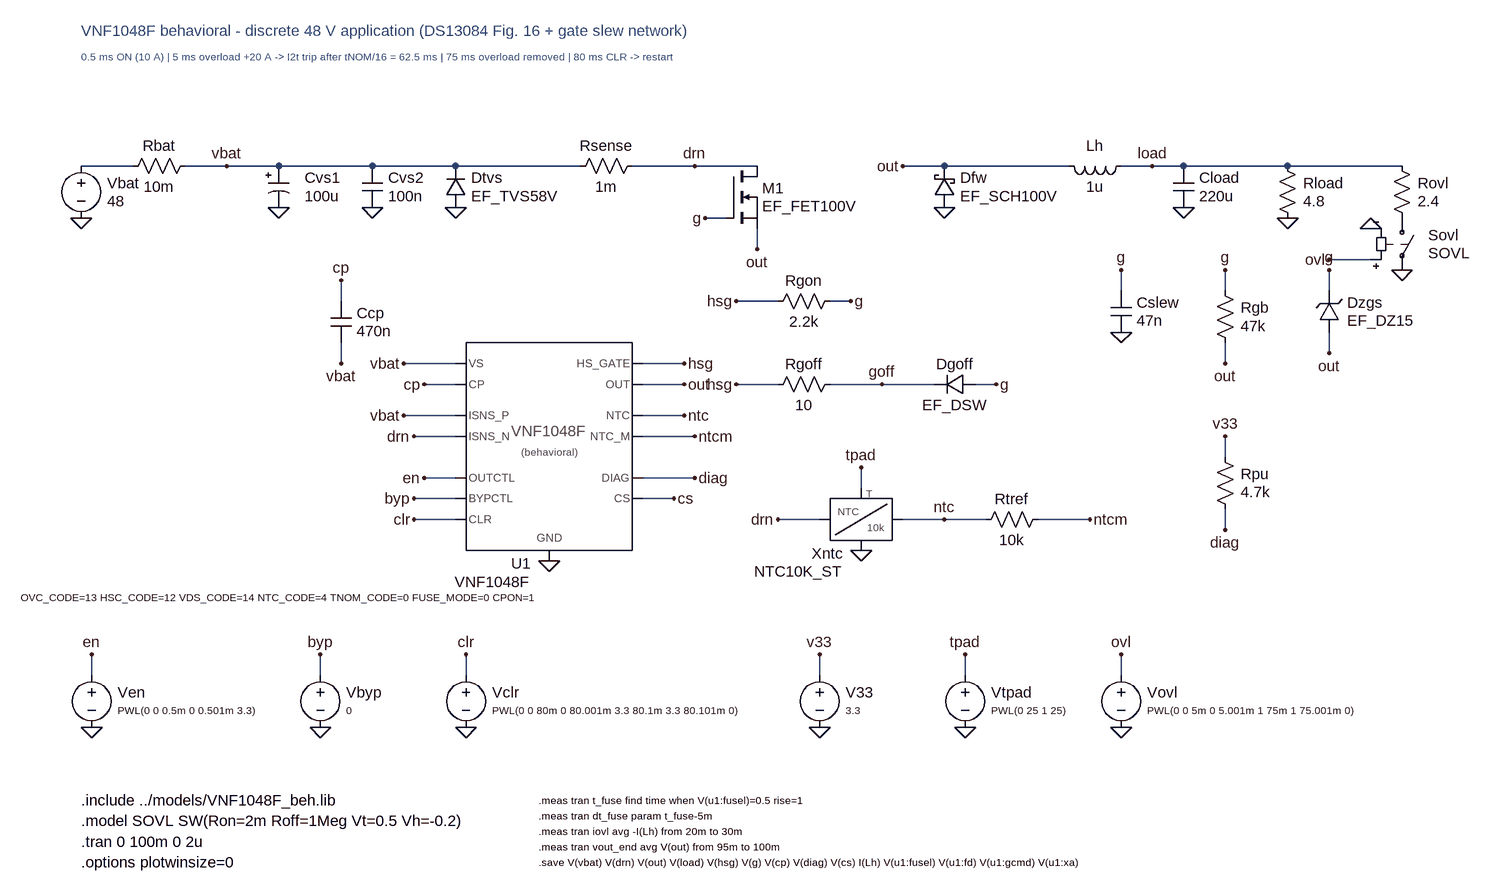
[diagram p0: schematic app_vnf1048f_discrete.asc]
app_vnf1048f_discrete.asc, the LTspice schematic file:
Version 4
SHEET 1 2300 1300
SYMBOL voltage 48 128 R0
WINDOW 0 40 42 Left 2
WINDOW 3 40 70 Left 2
SYMATTR InstName Vbat
SYMATTR Value 48
FLAG 48 224 0
SYMBOL res 224 128 R90
WINDOW 0 0 56 VBottom 2
WINDOW 3 32 56 VTop 2
SYMATTR InstName Rbat
SYMATTR Value 10m
WIRE 48 144 128 144
SYMBOL polcap 336 144 R0
WINDOW 0 56 18 Left 2
WINDOW 3 56 46 Left 2
SYMATTR InstName Cvs1
SYMATTR Value 100u
SYMATTR SpiceLine Rser=30m
FLAG 352 208 0
WIRE 208 144 272 144
WIRE 272 144 352 144
FLAG 272 144 vbat
SYMBOL cap 480 144 R0
WINDOW 0 40 18 Left 2
WINDOW 3 40 46 Left 2
SYMATTR InstName Cvs2
SYMATTR Value 100n
FLAG 496 208 0
WIRE 352 144 496 144
SYMBOL diode 640 208 R180
WINDOW 0 -8 46 Right 2
WINDOW 3 -8 18 Right 2
SYMATTR InstName Dtvs
SYMATTR Value EF_TVS58V
FLAG 624 208 0
WIRE 496 144 624 144
SYMBOL res 912 128 R90
WINDOW 0 0 56 VBottom 2
WINDOW 3 32 56 VTop 2
SYMATTR InstName Rsense
SYMATTR Value 1m
WIRE 624 144 816 144
SYMBOL nmos 1040 144 R0
WINDOW 0 56 34 Left 2
WINDOW 3 56 62 Left 2
SYMATTR InstName M1
SYMATTR Value EF_FET100V
WIRE 896 144 992 144
WIRE 992 144 1088 144
FLAG 992 144 drn
WIRE 1040 224 1008 224
FLAG 1008 224 g
WIRE 1088 240 1088 272
FLAG 1088 272 out
SYMBOL VNF1048F 768 576 R0
SYMATTR InstName U1
SYMATTR SpiceLine OVC_CODE=13 HSC_CODE=12 VDS_CODE=14 NTC_CODE=4 TNOM_CODE=0 FUSE_MODE=0 CPON=1
WIRE 624 448 544 448
FLAG 544 448 vbat
WIRE 624 480 576 480
FLAG 576 480 cp
WIRE 624 528 544 528
FLAG 544 528 vbat
WIRE 624 560 560 560
FLAG 560 560 drn
WIRE 912 448 976 448
FLAG 976 448 hsg
WIRE 912 480 976 480
FLAG 976 480 out
WIRE 912 528 976 528
FLAG 976 528 ntc
WIRE 912 560 992 560
FLAG 992 560 ntcm
FLAG 768 752 0
WIRE 912 624 992 624
FLAG 992 624 diag
WIRE 624 624 576 624
FLAG 576 624 en
WIRE 624 656 560 656
FLAG 560 656 byp
WIRE 624 688 560 688
FLAG 560 688 clr
WIRE 912 656 960 656
FLAG 960 656 cs
SYMBOL cap 432 352 R0
WINDOW 0 40 18 Left 2
WINDOW 3 40 46 Left 2
SYMATTR InstName Ccp
SYMATTR Value 470n
WIRE 448 352 448 320
FLAG 448 320 cp
WIRE 448 416 448 448
FLAG 448 448 vbat
SYMBOL res 1216 336 R90
WINDOW 0 0 56 VBottom 2
WINDOW 3 32 56 VTop 2
SYMATTR InstName Rgon
SYMATTR Value 2.2k
WIRE 1120 352 1056 352
FLAG 1056 352 hsg
WIRE 1200 352 1232 352
FLAG 1232 352 g
SYMBOL res 1216 464 R90
WINDOW 0 0 56 VBottom 2
WINDOW 3 32 56 VTop 2
SYMATTR InstName Rgoff
SYMATTR Value 10
WIRE 1120 480 1056 480
FLAG 1056 480 hsg
SYMBOL diode 1424 464 R90
WINDOW 0 0 32 VBottom 2
WINDOW 3 32 32 VTop 2
SYMATTR InstName Dgoff
SYMATTR Value EF_DSW
WIRE 1200 480 1280 480
WIRE 1280 480 1360 480
FLAG 1280 480 goff
WIRE 1424 480 1456 480
FLAG 1456 480 g
SYMBOL cap 1632 336 R0
WINDOW 0 40 18 Left 2
WINDOW 3 40 46 Left 2
SYMATTR InstName Cslew
SYMATTR Value 47n
WIRE 1648 336 1648 304
FLAG 1648 304 g
FLAG 1648 400 0
SYMBOL res 1792 320 R0
WINDOW 0 40 42 Left 2
WINDOW 3 40 70 Left 2
SYMATTR InstName Rgb
SYMATTR Value 47k
WIRE 1808 336 1808 304
FLAG 1808 304 g
WIRE 1808 416 1808 448
FLAG 1808 448 out
SYMBOL zener 1984 400 R180
WINDOW 0 -12 46 Right 2
WINDOW 3 -12 18 Right 2
SYMATTR InstName Dzgs
SYMATTR Value EF_DZ15
WIRE 1968 336 1968 304
FLAG 1968 304 g
WIRE 1968 400 1968 432
FLAG 1968 432 out
SYMBOL NTC10K_ST 1248 688 R0
SYMATTR InstName Xntc
WIRE 1184 688 1120 688
FLAG 1120 688 drn
WIRE 1248 640 1248 608
FLAG 1248 608 tpad
FLAG 1248 736 0
SYMBOL res 1536 672 R90
WINDOW 0 0 56 VBottom 2
WINDOW 3 32 56 VTop 2
SYMATTR InstName Rtref
SYMATTR Value 10k
WIRE 1312 688 1376 688
WIRE 1376 688 1440 688
FLAG 1376 688 ntc
WIRE 1520 688 1600 688
FLAG 1600 688 ntcm
SYMBOL res 1792 576 R0
WINDOW 0 40 42 Left 2
WINDOW 3 40 70 Left 2
SYMATTR InstName Rpu
SYMATTR Value 4.7k
WIRE 1808 592 1808 560
FLAG 1808 560 v33
WIRE 1808 672 1808 704
FLAG 1808 704 diag
SYMBOL schottky 1392 208 R180
WINDOW 0 -8 46 Right 2
WINDOW 3 -8 18 Right 2
SYMATTR InstName Dfw
SYMATTR Value EF_SCH100V
FLAG 1376 208 0
WIRE 1312 144 1376 144
FLAG 1312 144 out
SYMBOL ind 1664 128 R90
WINDOW 0 0 56 VBottom 2
WINDOW 3 32 56 VTop 2
SYMATTR InstName Lh
SYMATTR Value 1u
WIRE 1376 144 1568 144
SYMBOL cap 1728 144 R0
WINDOW 0 40 18 Left 2
WINDOW 3 40 46 Left 2
SYMATTR InstName Cload
SYMATTR Value 220u
SYMATTR SpiceLine Rser=20m
FLAG 1744 208 0
WIRE 1648 144 1696 144
WIRE 1696 144 1744 144
FLAG 1696 144 load
SYMBOL res 1888 128 R0
WINDOW 0 40 42 Left 2
WINDOW 3 40 70 Left 2
SYMATTR InstName Rload
SYMATTR Value 4.8
WIRE 1744 144 1904 144
FLAG 1904 224 0
SYMBOL res 2064 128 R0
WINDOW 0 40 42 Left 2
WINDOW 3 40 70 Left 2
SYMATTR InstName Rovl
SYMATTR Value 2.4
WIRE 1904 144 2080 144
SYMBOL sw 2080 208 R0
WINDOW 0 40 42 Left 2
WINDOW 3 40 70 Left 2
SYMATTR InstName Sovl
SYMATTR Value SOVL
FLAG 2080 304 0
WIRE 2032 288 1968 288
FLAG 1968 288 ovl
FLAG 2032 240 0
SYMBOL voltage 64 912 R0
WINDOW 0 40 42 Left 2
WINDOW 3 40 70 Left 1
SYMATTR InstName Ven
SYMATTR Value PWL(0 0 0.5m 0 0.501m 3.3)
WIRE 64 928 64 896
FLAG 64 896 en
FLAG 64 1008 0
SYMBOL voltage 416 912 R0
WINDOW 0 40 42 Left 2
WINDOW 3 40 70 Left 1
SYMATTR InstName Vbyp
SYMATTR Value 0
WIRE 416 928 416 896
FLAG 416 896 byp
FLAG 416 1008 0
SYMBOL voltage 640 912 R0
WINDOW 0 40 42 Left 2
WINDOW 3 40 70 Left 1
SYMATTR InstName Vclr
SYMATTR Value PWL(0 0 80m 0 80.001m 3.3 80.1m 3.3 80.101m 0)
WIRE 640 928 640 896
FLAG 640 896 clr
FLAG 640 1008 0
SYMBOL voltage 1184 912 R0
WINDOW 0 40 42 Left 2
WINDOW 3 40 70 Left 1
SYMATTR InstName V33
SYMATTR Value 3.3
WIRE 1184 928 1184 896
FLAG 1184 896 v33
FLAG 1184 1008 0
SYMBOL voltage 1408 912 R0
WINDOW 0 40 42 Left 2
WINDOW 3 40 70 Left 1
SYMATTR InstName Vtpad
SYMATTR Value PWL(0 25 1 25)
WIRE 1408 928 1408 896
FLAG 1408 896 tpad
FLAG 1408 1008 0
SYMBOL voltage 1648 912 R0
WINDOW 0 40 42 Left 2
WINDOW 3 40 70 Left 1
SYMATTR InstName Vovl
SYMATTR Value PWL(0 0 5m 0 5.001m 1 75m 1 75.001m 0)
WIRE 1648 928 1648 896
FLAG 1648 896 ovl
FLAG 1648 1008 0
TEXT 48 -64 Left 2 ;VNF1048F behavioral - discrete 48 V application (DS13084 Fig. 16 + gate slew network)
TEXT 48 -24 Left 1 ;0.5 ms ON (10 A) | 5 ms overload +20 A -> I2t trip after tNOM/16 = 62.5 ms | 75 ms overload removed | 80 ms CLR -> restart
TEXT 48 1120 Left 2 !.include ../models/VNF1048F_beh.lib
TEXT 48 1152 Left 2 !.model SOVL SW(Ron=2m Roff=1Meg Vt=0.5 Vh=-0.2)
TEXT 48 1184 Left 2 !.tran 0 100m 0 2u
TEXT 48 1216 Left 2 !.options plotwinsize=0
TEXT 752 1120 Left 1 !.meas tran t_fuse find time when V(u1:fusel)=0.5 rise=1
TEXT 752 1144 Left 1 !.meas tran dt_fuse param t_fuse-5m
TEXT 752 1168 Left 1 !.meas tran iovl avg -I(Lh) from 20m to 30m
TEXT 752 1192 Left 1 !.meas tran vout_end avg V(out) from 95m to 100m
TEXT 752 1216 Left 1 !.save V(vbat) V(drn) V(out) V(load) V(hsg) V(g) V(cp) V(diag) V(cs) I(Lh) V(u1:fusel) V(u1:fd) V(u1:gcmd) V(u1:xa)

The netlist it stands for:
* app_vnf1048f_discrete.asc
Vbat N001 0 48
Rbat vbat N001 10m
Cvs1 vbat 0 100u Rser=30m
Cvs2 vbat 0 100n
Dtvs 0 vbat EF_TVS58V
Rsense drn vbat 1m
M1 drn g out out EF_FET100V
XU1 vbat cp vbat drn hsg out ntc ntcm 0 diag en byp clr cs VNF1048F OVC_CODE=13 HSC_CODE=12 VDS_CODE=14 NTC_CODE=4 TNOM_CODE=0 FUSE_MODE=0 CPON=1  ; pins VS CP ISNS_P ISNS_N HS_GATE OUT NTC NTC_M GND DIAG OUTCTL BYPCTL CLR CS
Ccp cp vbat 470n
Rgon g hsg 2.2k
Rgoff goff hsg 10
Dgoff g goff EF_DSW
Cslew g 0 47n
Rgb g out 47k
Dzgs out g EF_DZ15
XXntc drn ntc tpad 0 NTC10K_ST  ; pins A B T GND
Rtref ntcm ntc 10k
Rpu v33 diag 4.7k
Dfw 0 out EF_SCH100V
Lh load out 1u
Cload load 0 220u Rser=20m
Rload load 0 4.8
Rovl load P001 2.4
Sovl P001 0 ovl 0 SOVL
Ven en 0 PWL(0 0 0.5m 0 0.501m 3.3)
Vbyp byp 0 0
Vclr clr 0 PWL(0 0 80m 0 80.001m 3.3 80.1m 3.3 80.101m 0)
V33 v33 0 3.3
Vtpad tpad 0 PWL(0 25 1 25)
Vovl ovl 0 PWL(0 0 5m 0 5.001m 1 75m 1 75.001m 0)
.model D D
.lib standard.dio
.model NMOS NMOS
.model PMOS PMOS
.lib standard.mos
* VNF1048F behavioral - discrete 48 V application (DS13084 Fig. 16 + gate slew network)
* 0.5 ms ON (10 A) | 5 ms overload +20 A -> I2t trip after tNOM/16 = 62.5 ms | 75 ms overload removed | 80 ms CLR -> restart
.include ../models/VNF1048F_beh.lib
.model SOVL SW(Ron=2m Roff=1Meg Vt=0.5 Vh=-0.2)
.tran 0 100m 0 2u
.options plotwinsize=0
.meas tran t_fuse find time when V(u1:fusel)=0.5 rise=1
.meas tran dt_fuse param t_fuse-5m
.meas tran iovl avg -I(Lh) from 20m to 30m
.meas tran vout_end avg V(out) from 95m to 100m
.save V(vbat) V(drn) V(out) V(load) V(hsg) V(g) V(cp) V(diag) V(cs) I(Lh) V(u1:fusel) V(u1:fd) V(u1:gcmd) V(u1:xa)
.backanno
.end